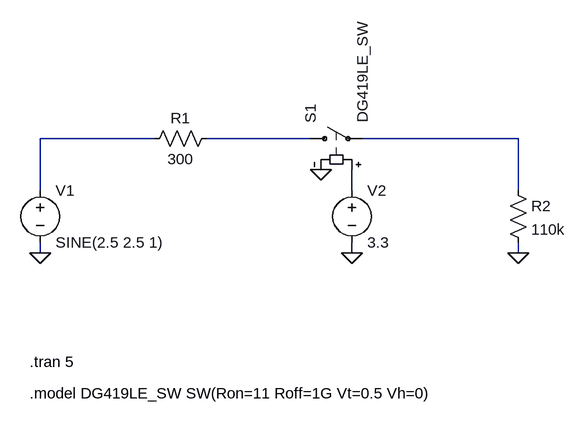
[diagram p0: schematic Analog Switch.asc]
Analog Switch.asc, the LTspice schematic file:
Version 4.1
SHEET 1 880 680
WIRE -320 160 -496 160
WIRE -80 160 -240 160
WIRE 240 160 0 160
WIRE -496 240 -496 160
WIRE -16 240 -16 208
WIRE 240 240 240 160
WIRE -496 336 -496 320
WIRE -16 336 -16 320
WIRE 240 336 240 320
FLAG -496 336 0
FLAG 240 336 0
FLAG -16 336 0
FLAG -64 208 0
SYMBOL sw -96 160 R270
SYMATTR InstName S1
SYMATTR Value DG419LE_SW
SYMBOL voltage -496 224 R0
WINDOW 123 0 0 Left 0
WINDOW 39 0 0 Left 0
SYMATTR InstName V1
SYMATTR Value SINE(2.5 2.5 1)
SYMBOL res -224 144 R90
WINDOW 0 0 56 VBottom 2
WINDOW 3 32 56 VTop 2
SYMATTR InstName R1
SYMATTR Value 300
SYMBOL res 224 224 R0
SYMATTR InstName R2
SYMATTR Value 110k
SYMBOL voltage -16 224 R0
WINDOW 123 0 0 Left 0
WINDOW 39 0 0 Left 0
SYMATTR InstName V2
SYMATTR Value 3.3
TEXT -512 552 Left 2 !.model DG419LE_SW SW(Ron=11 Roff=1G Vt=0.5 Vh=0)
TEXT -512 504 Left 2 !.tran 5

The netlist it stands for:
* Analog Switch.asc
S1 N002 N003 N004 0 DG419LE_SW
V1 N001 0 SINE(2.5 2.5 1)
R1 N002 N001 300
R2 N003 0 110k
V2 N004 0 3.3
.model DG419LE_SW SW(Ron=11 Roff=1G Vt=0.5 Vh=0)
.tran 5
.backanno
.end